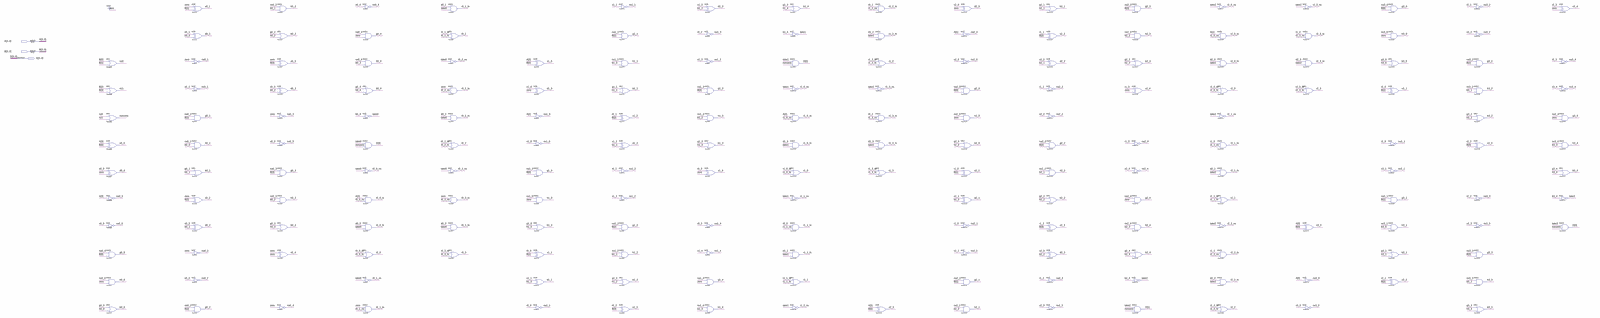
[diagram p0: schematic sheet, whole]
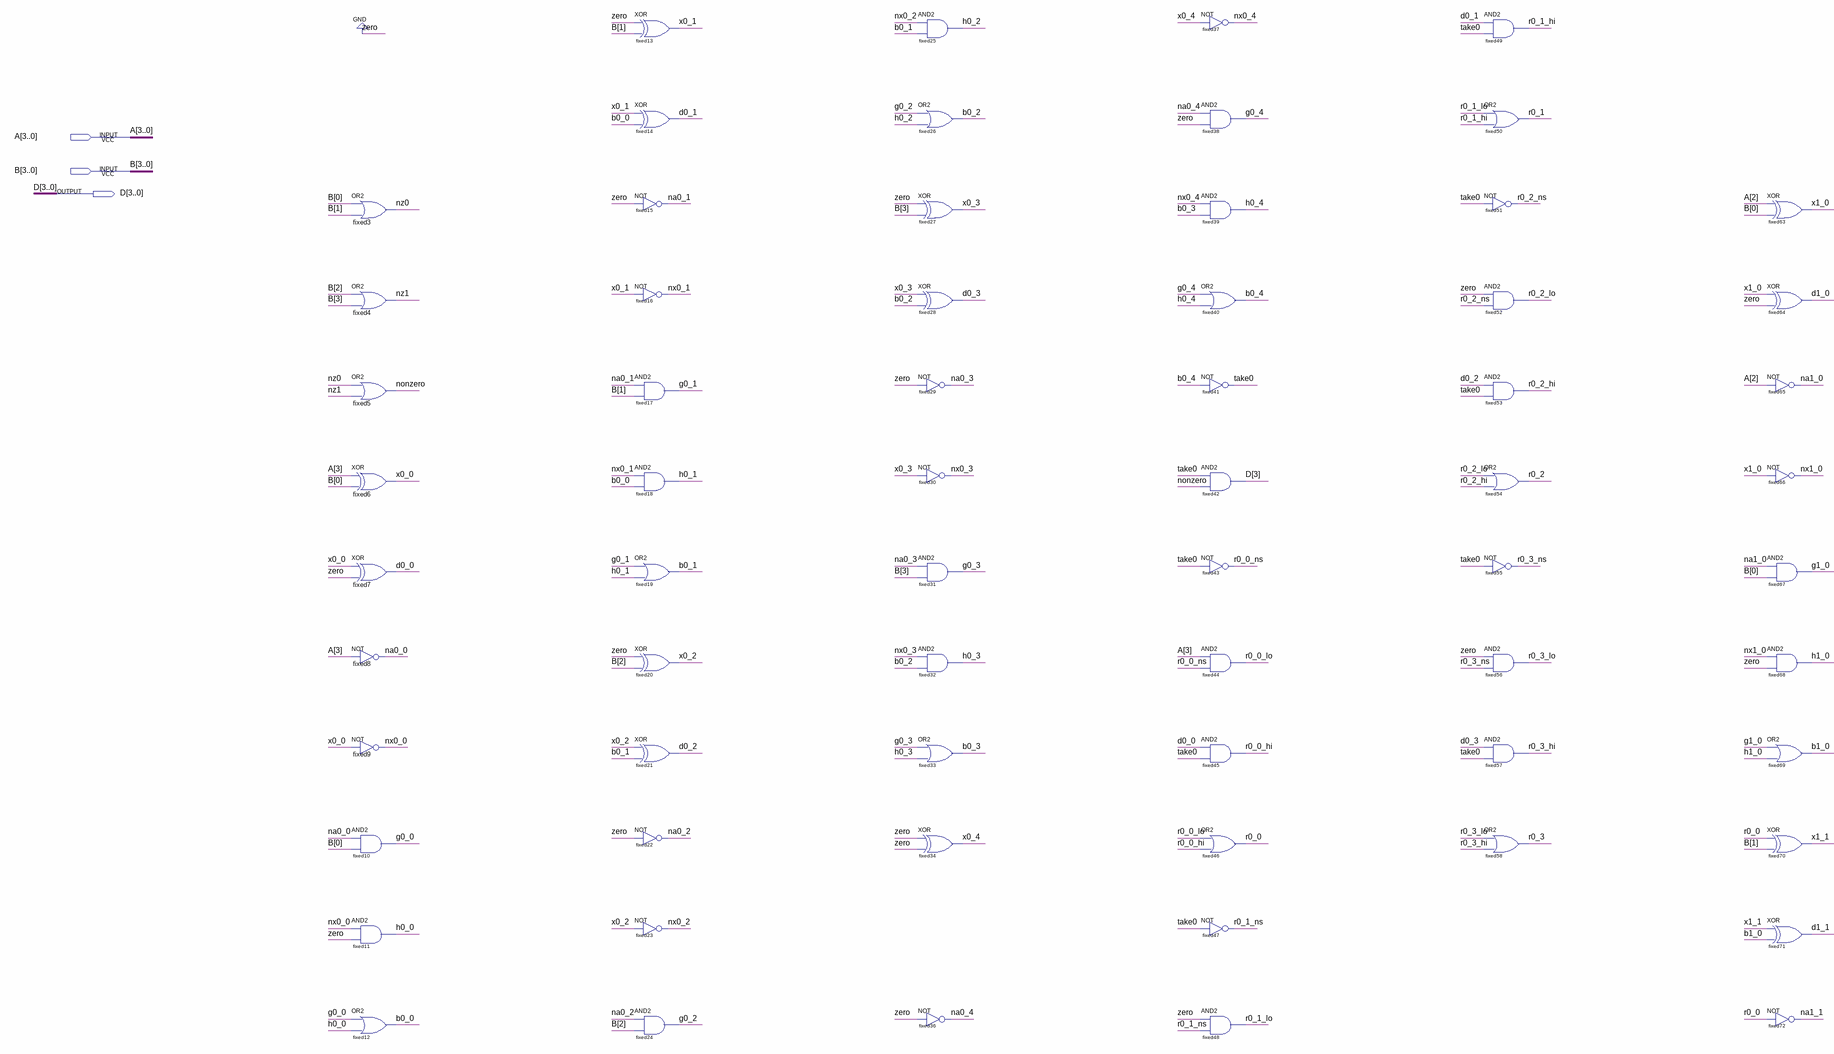
[diagram p1: schematic sheet, left part]
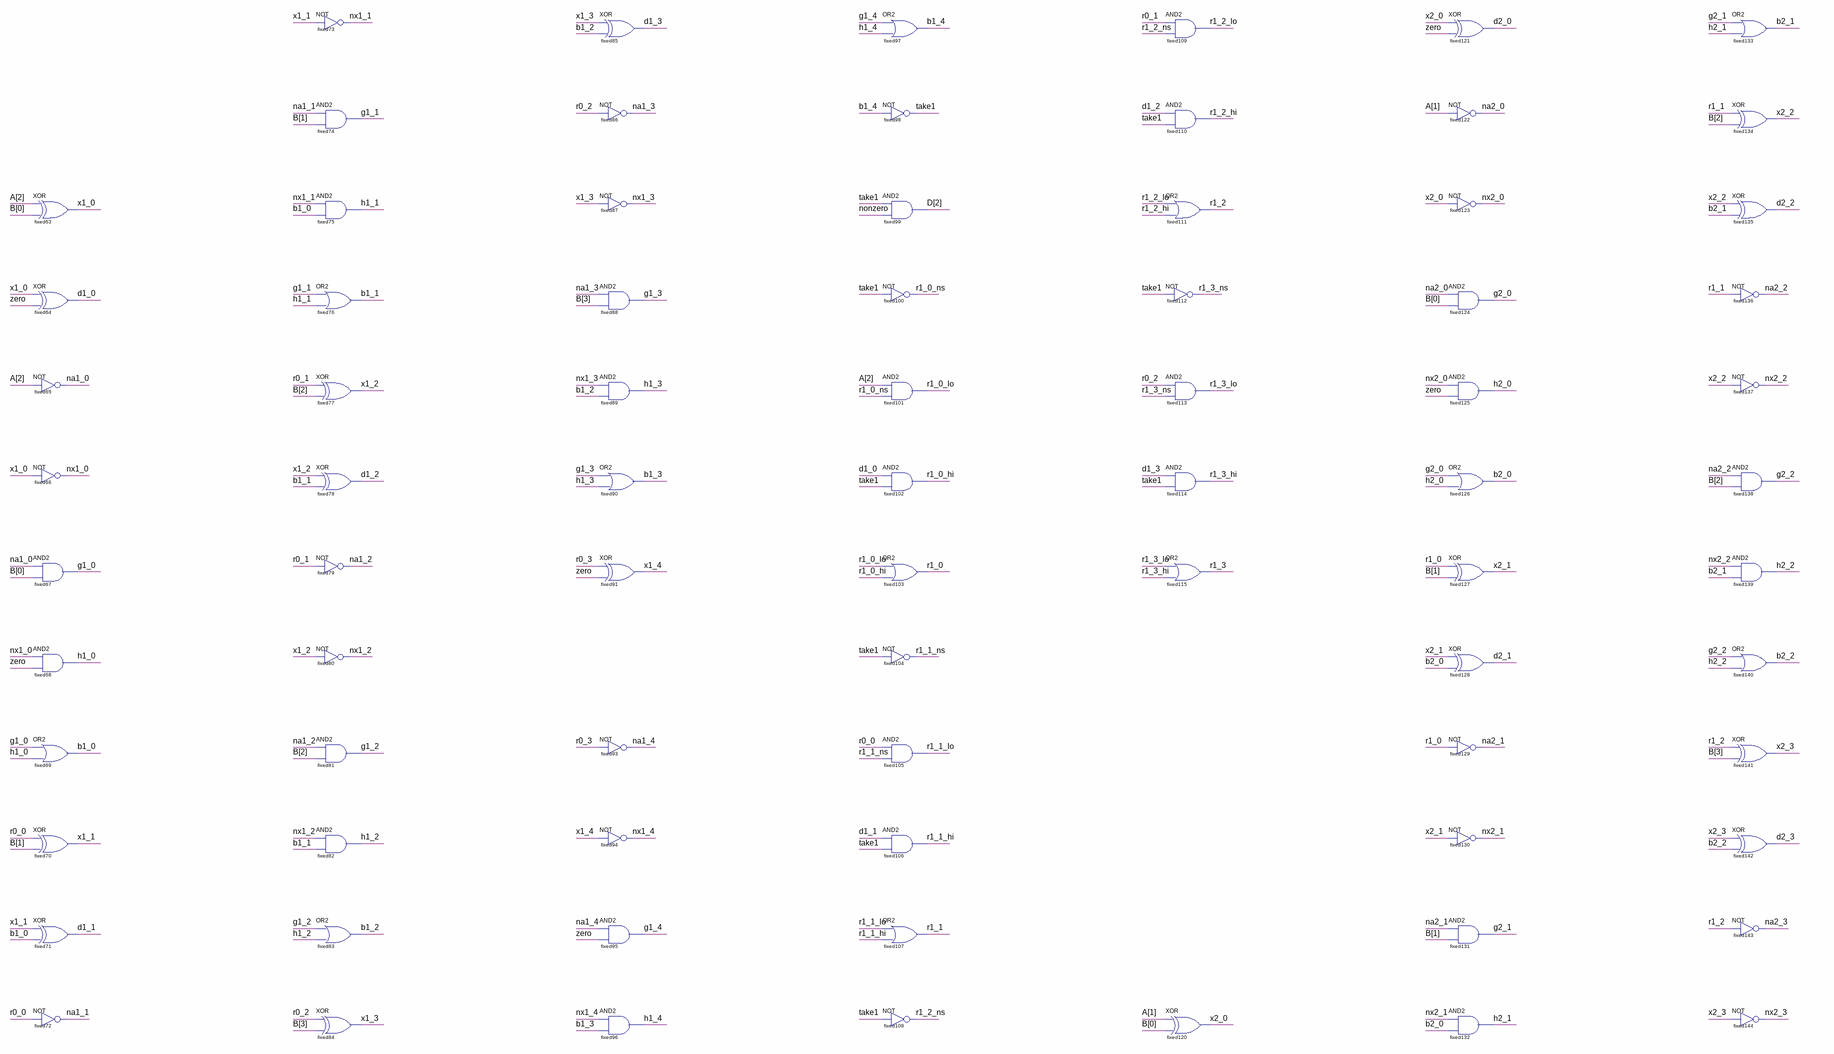
[diagram p2: schematic sheet, centre part]
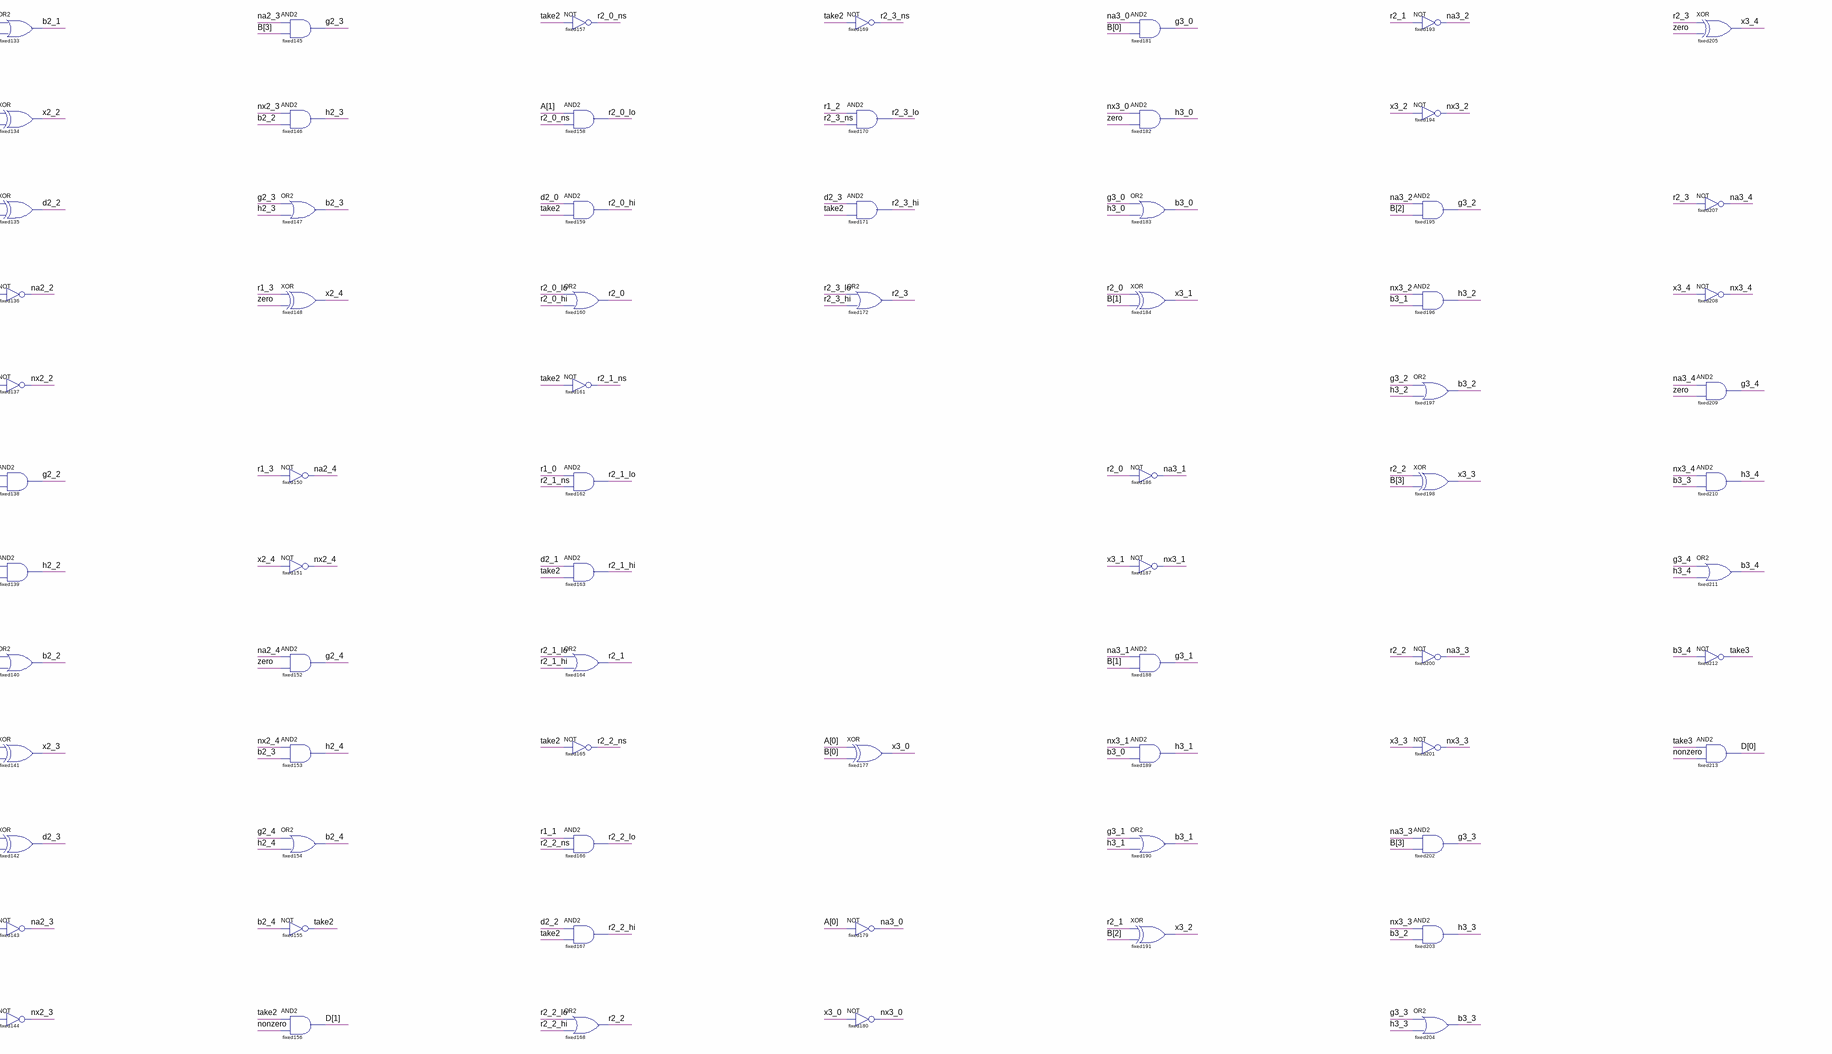
[diagram p3: schematic sheet, right part]
// Quartus schematic div.bdf as structural Verilog: 191 symbols, 3 pins
module div (
  input  [3:0] A,
  input  [3:0] B,
  output [3:0] D
);

  wire b0_0, b0_1, b0_2, b0_3, b0_4, b1_0, b1_1, b1_2, b1_3, b1_4, b2_0, b2_1, b2_2, b2_3, b2_4, b3_0, b3_1,
       b3_2, b3_3, b3_4, d0_0, d0_1, d0_2, d0_3, d1_0, d1_1, d1_2, d1_3, d2_0, d2_1, d2_2, d2_3, g0_0, g0_1,
       g0_2, g0_3, g0_4, g1_0, g1_1, g1_2, g1_3, g1_4, g2_0, g2_1, g2_2, g2_3, g2_4, g3_0, g3_1, g3_2, g3_3,
       g3_4, h0_0, h0_1, h0_2, h0_3, h0_4, h1_0, h1_1, h1_2, h1_3, h1_4, h2_0, h2_1, h2_2, h2_3, h2_4, h3_0,
       h3_1, h3_2, h3_3, h3_4, na0_0, na0_1, na0_2, na0_3, na0_4, na1_0, na1_1, na1_2, na1_3, na1_4, na2_0,
       na2_1, na2_2, na2_3, na2_4, na3_0, na3_1, na3_2, na3_3, na3_4, nonzero, nx0_0, nx0_1, nx0_2, nx0_3,
       nx0_4, nx1_0, nx1_1, nx1_2, nx1_3, nx1_4, nx2_0, nx2_1, nx2_2, nx2_3, nx2_4, nx3_0, nx3_1, nx3_2,
       nx3_3, nx3_4, nz0, nz1, r0_0, r0_0_hi, r0_0_lo, r0_0_ns, r0_1, r0_1_hi, r0_1_lo, r0_1_ns, r0_2,
       r0_2_hi, r0_2_lo, r0_2_ns, r0_3, r0_3_hi, r0_3_lo, r0_3_ns, r1_0, r1_0_hi, r1_0_lo, r1_0_ns, r1_1,
       r1_1_hi, r1_1_lo, r1_1_ns, r1_2, r1_2_hi, r1_2_lo, r1_2_ns, r1_3, r1_3_hi, r1_3_lo, r1_3_ns, r2_0,
       r2_0_hi, r2_0_lo, r2_0_ns, r2_1, r2_1_hi, r2_1_lo, r2_1_ns, r2_2, r2_2_hi, r2_2_lo, r2_2_ns, r2_3,
       r2_3_hi, r2_3_lo, r2_3_ns, take0, take1, take2, take3, x0_0, x0_1, x0_2, x0_3, x0_4, x1_0, x1_1, x1_2,
       x1_3, x1_4, x2_0, x2_1, x2_2, x2_3, x2_4, x3_0, x3_1, x3_2, x3_3, x3_4;

  or fixed3 (nz0, B[0], B[1]);
  or fixed4 (nz1, B[2], B[3]);
  or fixed5 (nonzero, nz0, nz1);
  xor fixed6 (x0_0, A[3], B[0]);
  xor fixed7 (d0_0, x0_0, 1'b0);
  not fixed8 (na0_0, A[3]);
  not fixed9 (nx0_0, x0_0);
  and fixed10 (g0_0, na0_0, B[0]);
  and fixed11 (h0_0, nx0_0, 1'b0);
  or fixed12 (b0_0, g0_0, h0_0);
  xor fixed13 (x0_1, 1'b0, B[1]);
  xor fixed14 (d0_1, x0_1, b0_0);
  not fixed15 (na0_1, 1'b0);
  not fixed16 (nx0_1, x0_1);
  and fixed17 (g0_1, na0_1, B[1]);
  and fixed18 (h0_1, nx0_1, b0_0);
  or fixed19 (b0_1, g0_1, h0_1);
  xor fixed20 (x0_2, 1'b0, B[2]);
  xor fixed21 (d0_2, x0_2, b0_1);
  not fixed22 (na0_2, 1'b0);
  not fixed23 (nx0_2, x0_2);
  and fixed24 (g0_2, na0_2, B[2]);
  and fixed25 (h0_2, nx0_2, b0_1);
  or fixed26 (b0_2, g0_2, h0_2);
  xor fixed27 (x0_3, 1'b0, B[3]);
  xor fixed28 (d0_3, x0_3, b0_2);
  not fixed29 (na0_3, 1'b0);
  not fixed30 (nx0_3, x0_3);
  and fixed31 (g0_3, na0_3, B[3]);
  and fixed32 (h0_3, nx0_3, b0_2);
  or fixed33 (b0_3, g0_3, h0_3);
  xor fixed34 (x0_4, 1'b0, 1'b0);
  not fixed36 (na0_4, 1'b0);
  not fixed37 (nx0_4, x0_4);
  and fixed38 (g0_4, na0_4, 1'b0);
  and fixed39 (h0_4, nx0_4, b0_3);
  or fixed40 (b0_4, g0_4, h0_4);
  not fixed41 (take0, b0_4);
  and fixed42 (D[3], take0, nonzero);
  not fixed43 (r0_0_ns, take0);
  and fixed44 (r0_0_lo, A[3], r0_0_ns);
  and fixed45 (r0_0_hi, d0_0, take0);
  or fixed46 (r0_0, r0_0_lo, r0_0_hi);
  not fixed47 (r0_1_ns, take0);
  and fixed48 (r0_1_lo, 1'b0, r0_1_ns);
  and fixed49 (r0_1_hi, d0_1, take0);
  or fixed50 (r0_1, r0_1_lo, r0_1_hi);
  not fixed51 (r0_2_ns, take0);
  and fixed52 (r0_2_lo, 1'b0, r0_2_ns);
  and fixed53 (r0_2_hi, d0_2, take0);
  or fixed54 (r0_2, r0_2_lo, r0_2_hi);
  not fixed55 (r0_3_ns, take0);
  and fixed56 (r0_3_lo, 1'b0, r0_3_ns);
  and fixed57 (r0_3_hi, d0_3, take0);
  or fixed58 (r0_3, r0_3_lo, r0_3_hi);
  xor fixed63 (x1_0, A[2], B[0]);
  xor fixed64 (d1_0, x1_0, 1'b0);
  not fixed65 (na1_0, A[2]);
  not fixed66 (nx1_0, x1_0);
  and fixed67 (g1_0, na1_0, B[0]);
  and fixed68 (h1_0, nx1_0, 1'b0);
  or fixed69 (b1_0, g1_0, h1_0);
  xor fixed70 (x1_1, r0_0, B[1]);
  xor fixed71 (d1_1, x1_1, b1_0);
  not fixed72 (na1_1, r0_0);
  not fixed73 (nx1_1, x1_1);
  and fixed74 (g1_1, na1_1, B[1]);
  and fixed75 (h1_1, nx1_1, b1_0);
  or fixed76 (b1_1, g1_1, h1_1);
  xor fixed77 (x1_2, r0_1, B[2]);
  xor fixed78 (d1_2, x1_2, b1_1);
  not fixed79 (na1_2, r0_1);
  not fixed80 (nx1_2, x1_2);
  and fixed81 (g1_2, na1_2, B[2]);
  and fixed82 (h1_2, nx1_2, b1_1);
  or fixed83 (b1_2, g1_2, h1_2);
  xor fixed84 (x1_3, r0_2, B[3]);
  xor fixed85 (d1_3, x1_3, b1_2);
  not fixed86 (na1_3, r0_2);
  not fixed87 (nx1_3, x1_3);
  and fixed88 (g1_3, na1_3, B[3]);
  and fixed89 (h1_3, nx1_3, b1_2);
  or fixed90 (b1_3, g1_3, h1_3);
  xor fixed91 (x1_4, r0_3, 1'b0);
  not fixed93 (na1_4, r0_3);
  not fixed94 (nx1_4, x1_4);
  and fixed95 (g1_4, na1_4, 1'b0);
  and fixed96 (h1_4, nx1_4, b1_3);
  or fixed97 (b1_4, g1_4, h1_4);
  not fixed98 (take1, b1_4);
  and fixed99 (D[2], take1, nonzero);
  not fixed100 (r1_0_ns, take1);
  and fixed101 (r1_0_lo, A[2], r1_0_ns);
  and fixed102 (r1_0_hi, d1_0, take1);
  or fixed103 (r1_0, r1_0_lo, r1_0_hi);
  not fixed104 (r1_1_ns, take1);
  and fixed105 (r1_1_lo, r0_0, r1_1_ns);
  and fixed106 (r1_1_hi, d1_1, take1);
  or fixed107 (r1_1, r1_1_lo, r1_1_hi);
  not fixed108 (r1_2_ns, take1);
  and fixed109 (r1_2_lo, r0_1, r1_2_ns);
  and fixed110 (r1_2_hi, d1_2, take1);
  or fixed111 (r1_2, r1_2_lo, r1_2_hi);
  not fixed112 (r1_3_ns, take1);
  and fixed113 (r1_3_lo, r0_2, r1_3_ns);
  and fixed114 (r1_3_hi, d1_3, take1);
  or fixed115 (r1_3, r1_3_lo, r1_3_hi);
  xor fixed120 (x2_0, A[1], B[0]);
  xor fixed121 (d2_0, x2_0, 1'b0);
  not fixed122 (na2_0, A[1]);
  not fixed123 (nx2_0, x2_0);
  and fixed124 (g2_0, na2_0, B[0]);
  and fixed125 (h2_0, nx2_0, 1'b0);
  or fixed126 (b2_0, g2_0, h2_0);
  xor fixed127 (x2_1, r1_0, B[1]);
  xor fixed128 (d2_1, x2_1, b2_0);
  not fixed129 (na2_1, r1_0);
  not fixed130 (nx2_1, x2_1);
  and fixed131 (g2_1, na2_1, B[1]);
  and fixed132 (h2_1, nx2_1, b2_0);
  or fixed133 (b2_1, g2_1, h2_1);
  xor fixed134 (x2_2, r1_1, B[2]);
  xor fixed135 (d2_2, x2_2, b2_1);
  not fixed136 (na2_2, r1_1);
  not fixed137 (nx2_2, x2_2);
  and fixed138 (g2_2, na2_2, B[2]);
  and fixed139 (h2_2, nx2_2, b2_1);
  or fixed140 (b2_2, g2_2, h2_2);
  xor fixed141 (x2_3, r1_2, B[3]);
  xor fixed142 (d2_3, x2_3, b2_2);
  not fixed143 (na2_3, r1_2);
  not fixed144 (nx2_3, x2_3);
  and fixed145 (g2_3, na2_3, B[3]);
  and fixed146 (h2_3, nx2_3, b2_2);
  or fixed147 (b2_3, g2_3, h2_3);
  xor fixed148 (x2_4, r1_3, 1'b0);
  not fixed150 (na2_4, r1_3);
  not fixed151 (nx2_4, x2_4);
  and fixed152 (g2_4, na2_4, 1'b0);
  and fixed153 (h2_4, nx2_4, b2_3);
  or fixed154 (b2_4, g2_4, h2_4);
  not fixed155 (take2, b2_4);
  and fixed156 (D[1], take2, nonzero);
  not fixed157 (r2_0_ns, take2);
  and fixed158 (r2_0_lo, A[1], r2_0_ns);
  and fixed159 (r2_0_hi, d2_0, take2);
  or fixed160 (r2_0, r2_0_lo, r2_0_hi);
  not fixed161 (r2_1_ns, take2);
  and fixed162 (r2_1_lo, r1_0, r2_1_ns);
  and fixed163 (r2_1_hi, d2_1, take2);
  or fixed164 (r2_1, r2_1_lo, r2_1_hi);
  not fixed165 (r2_2_ns, take2);
  and fixed166 (r2_2_lo, r1_1, r2_2_ns);
  and fixed167 (r2_2_hi, d2_2, take2);
  or fixed168 (r2_2, r2_2_lo, r2_2_hi);
  not fixed169 (r2_3_ns, take2);
  and fixed170 (r2_3_lo, r1_2, r2_3_ns);
  and fixed171 (r2_3_hi, d2_3, take2);
  or fixed172 (r2_3, r2_3_lo, r2_3_hi);
  xor fixed177 (x3_0, A[0], B[0]);
  not fixed179 (na3_0, A[0]);
  not fixed180 (nx3_0, x3_0);
  and fixed181 (g3_0, na3_0, B[0]);
  and fixed182 (h3_0, nx3_0, 1'b0);
  or fixed183 (b3_0, g3_0, h3_0);
  xor fixed184 (x3_1, r2_0, B[1]);
  not fixed186 (na3_1, r2_0);
  not fixed187 (nx3_1, x3_1);
  and fixed188 (g3_1, na3_1, B[1]);
  and fixed189 (h3_1, nx3_1, b3_0);
  or fixed190 (b3_1, g3_1, h3_1);
  xor fixed191 (x3_2, r2_1, B[2]);
  not fixed193 (na3_2, r2_1);
  not fixed194 (nx3_2, x3_2);
  and fixed195 (g3_2, na3_2, B[2]);
  and fixed196 (h3_2, nx3_2, b3_1);
  or fixed197 (b3_2, g3_2, h3_2);
  xor fixed198 (x3_3, r2_2, B[3]);
  not fixed200 (na3_3, r2_2);
  not fixed201 (nx3_3, x3_3);
  and fixed202 (g3_3, na3_3, B[3]);
  and fixed203 (h3_3, nx3_3, b3_2);
  or fixed204 (b3_3, g3_3, h3_3);
  xor fixed205 (x3_4, r2_3, 1'b0);
  not fixed207 (na3_4, r2_3);
  not fixed208 (nx3_4, x3_4);
  and fixed209 (g3_4, na3_4, 1'b0);
  and fixed210 (h3_4, nx3_4, b3_3);
  or fixed211 (b3_4, g3_4, h3_4);
  not fixed212 (take3, b3_4);
  and fixed213 (D[0], take3, nonzero);
endmodule
